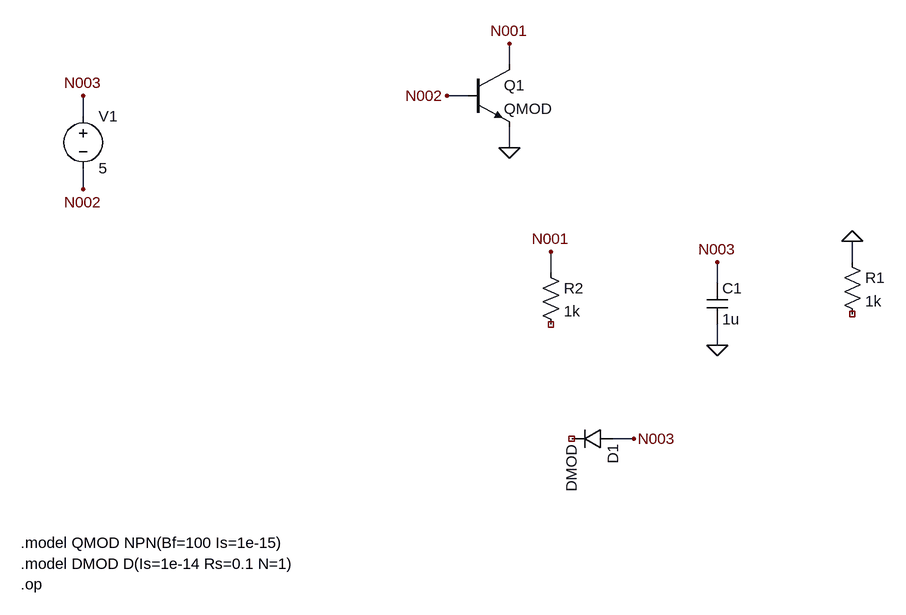
[diagram p0: schematic C1_D1_P1.asc]
C1_D1_P1.asc, the LTspice schematic file:
Version 4
SHEET 1 1664 976
WIRE 816 176 816 208
WIRE 1344 384 1344 352
WIRE 1136 480 1136 512
WIRE 816 80 816 48
WIRE 880 400 880 368
WIRE 752 128 720 128
WIRE 160 240 160 272
WIRE 160 160 160 128
WIRE 1136 416 1136 384
WIRE 976 656 1008 656
FLAG 816 208 0
FLAG 1344 352 0
FLAG 1136 512 0
FLAG 816 48 N001
FLAG 880 368 N001
FLAG 720 128 N002
FLAG 160 272 N002
FLAG 160 128 N003
FLAG 1136 384 N003
FLAG 1008 656 N003
SYMBOL npn 752 80 R0
SYMATTR InstName Q1
SYMATTR Value QMOD
SYMBOL voltage 160 144 R0
SYMATTR InstName V1
SYMATTR Value 5
SYMBOL res 1328 368 R0
SYMATTR InstName R1
SYMATTR Value 1k
SYMBOL res 864 384 R0
SYMATTR InstName R2
SYMATTR Value 1k
SYMBOL cap 1120 416 R0
SYMATTR InstName C1
SYMATTR Value 1u
SYMBOL diode 976 640 R90
SYMATTR InstName D1
SYMATTR Value DMOD
TEXT 64 816 Left 2 !.model QMOD NPN(Bf=100 Is=1e-15)
TEXT 64 848 Left 2 !.model DMOD D(Is=1e-14 Rs=0.1 N=1)
TEXT 64 880 Left 2 !.op

The netlist it stands for:
* C1_D1_P1.asc
Q1 N001 N002 0 0 QMOD
V1 N003 N002 5
R1 0 NC_01 1k
R2 N001 NC_02 1k
C1 N003 0 1u
D1 N003 NC_03 DMOD
.model D D
.lib standard.dio
.model NPN NPN
.model PNP PNP
.lib standard.bjt
.model QMOD NPN(Bf=100 Is=1e-15)
.model DMOD D(Is=1e-14 Rs=0.1 N=1)
.op
.backanno
.end